# Altium schematic sheet USB.SchDoc
size A; SheetNumber: 7; SheetTotal: 9
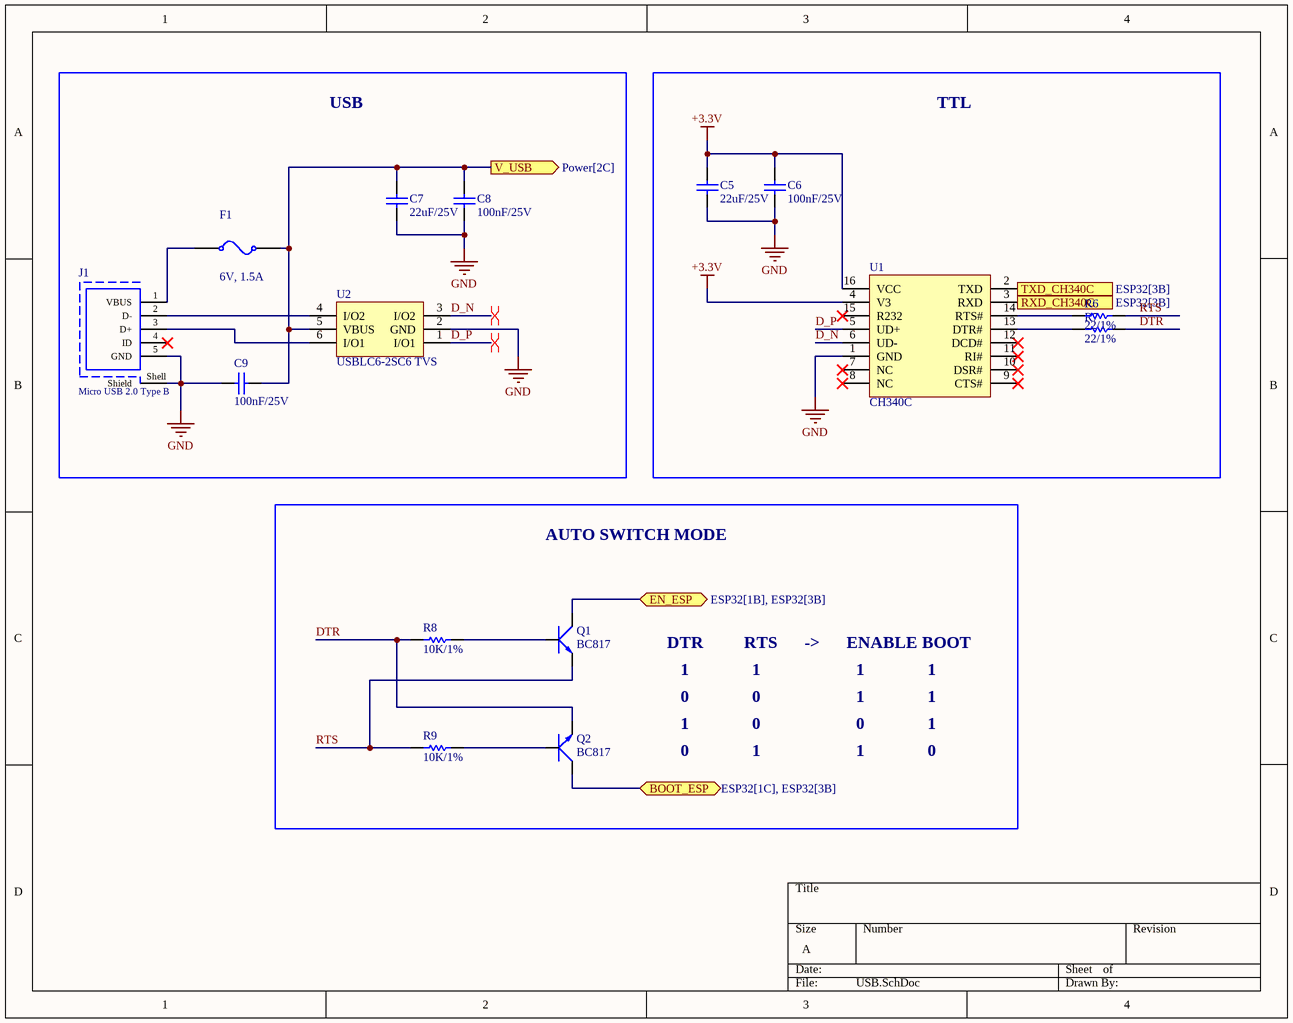
[diagram p0: USB.SchDoc]

## Parts
C5  value 22uF/25V  [CAP-SM-0805]  (hidden comment: Cap Non-Pol SMD)
C6  value 100nF/25V  [CAP-SM-0805]  (hidden comment: Cap Non-Pol SMD)
C7  value 22uF/25V  [CAP-SM-0805]  (hidden comment: Cap Non-Pol SMD)
C8  value 100nF/25V  [CAP-SM-0805]  (hidden comment: Cap Non-Pol SMD)
C9  value 100nF/25V  [CAP-SM-0805]  (hidden comment: Cap Non-Pol SMD)
F1  6V, 1.5A  [Fuse_SMD_1812]
J1  Micro USB 2.0 Type B  [629105150521]
Q1  BC817  [SOT-23]
Q2  BC817  [SOT-23]
R6  value 22/1%  [RES-SM-0805]  (hidden comment: RESISTOR SMD)
R7  value 22/1%  [RES-SM-0805]  (hidden comment: RESISTOR SMD)
R8  value 10K/1%  [RES-SM-0805]  (hidden comment: RESISTOR SMD)
R9  value 10K/1%  [RES-SM-0805]  (hidden comment: RESISTOR SMD)
U1  CH340C  [SOIC16_50_284_25X90_SMT]
U2  USBLC6-2SC6 TVS  [SOT23-6]

## Blocks framed on the sheet
USB: C7-C9 F1 J1 U2

## Ports
BOOT_ESP (bidir, see ESP32[1C], ESP32[3B]), EN_ESP (bidir, see ESP32[1B], ESP32[3B]), RXD_CH340C (in, see ESP32[3B]), TXD_CH340C (out, see ESP32[3B]), V_USB (out, see Power[2C])

## Nets
+3.3V: C5.1 C6.1 U1.4(V3) U1.16(VCC)
GND: C5.2 C6.2 C7.2 C8.2 C9.1 J1.5(GND) J1.Shell(Shield) U1.1(GND) U2.2(GND)
BOOT_ESP: Q2.3(C) ; port BOOT_ESP
D_N: U1.6(UD-) U2.3(I/O2)
D_P: U1.5(UD+) U2.1(I/O1)
DTR: Q2.2(E) R7.2 R8.1
EN_ESP: Q1.3(C) ; port EN_ESP
RTS: Q1.2(E) R6.2 R9.1
RXD_CH340C: U1.3(RXD) ; port RXD_CH340C
TXD_CH340C: U1.2(TXD) ; port TXD_CH340C
V_USB: C7.1 C8.1 C9.2 F1.1 U2.5(VBUS) ; port V_USB
NetF1_0: F1.0 J1.1(VBUS)
NetJ1_2: J1.2(D-) U2.4(I/O2)
NetJ1_3: J1.3(D+) U2.6(I/O1)
NetQ1_1: Q1.1(B) R8.2
NetQ2_1: Q2.1(B) R9.2
NetR6_1: R6.1 U1.14(RTS#)
NetR7_1: R7.1 U1.13(DTR#)

Not connected (* = marked no-connect by the designer): J1 4(ID)*; U1 7(NC)* 8(NC)* 9(CTS#)* 10(DSR#)* 11(RI#)* 12(DCD#)* 15(R232)*

## Layout directives
differential pair: D_N, D_P

## Notes on the sheet
- TTL
- AUTO SWITCH MODE
- DTR         RTS      ->      ENABLE BOOT
- 1              1
- 0              0
- 1              0
- 0              1

## Library data of the parts
C5-C9 = Cap Non-Pol SMD: Capacitor
F1 = 061812150024: Resettable Fuse, Size 1812, 24V, 1.5A; Manufacturer: Littelfuse; Threshold Current: 20A; Trip Current: 3A; Threshold Voltage: 24V; Hold Current: 1.5A; Size: 1812; Mounting Technology: SMT/SMD; ComponentLink1Description: Datasheet link; ComponentLink1URL: https://www.littelfuse.com/~/media/electronics/product_specifications/resettable_ptcs/littelfuse_ptc_minismdc300f_2_product_specification.pdf.pdf; ComponentLink2Description: Supplier 1 URL; ComponentLink2URL: https://www.mouser.vn/ProductDetail/Littelfuse/MINISMDC150F-24-2?qs=F6FIpiMdEVZ%2Fp37J%2FDHAxA%3D%3D; ComponentLink3Description: Supplier 2 URL; ComponentLink3URL: https://www.digikey.com/en/products/detail/littelfuse-inc/MINISMDC150F-24-2/1113513?s=N4IgTCBcDaILIEkByCDKcAiBhAjAVgAYAxAejABYBaCAXQF8g; ComponentLink4Description: Supplier 3 URL; ComponentLink4URL: https://www.thegioiic.com/cau-chi-tu-phuc-hoi-1812-24v-1-5a; Supplier 1 Name: Mouser; Supplier 1 SN: 650-MINISMDC150F/24; Supplier 1 URL: https://www.mouser.vn/ProductDetail/Littelfuse/MINISMDC150F-24-2?qs=F6FIpiMdEVZ%2Fp37J%2FDHAxA%3D%3D; Supplier 2 Name: Digi-Key; Supplier 2 SN: MINISMDC150F24-2TR-ND; Supplier 2 URL: https://www.mouser.vn/ProductDetail/Littelfuse/MINISMDC150F-24-2?qs=F6FIpiMdEVZ%2Fp37J%2FDHAxA%3D%3D; Supplier 3 Name: thegioiic; Supplier 3 SN: N/A; Supplier 3 URL: https://www.thegioiic.com/cau-chi-tu-phuc-hoi-1812-24v-1-5a; Value: 24V, 1.5A
J1 = 629105150521: Micro USB 2.0 Type B Receptacle WR-COM, Horizontal, SMT, with Pegs, High Current at Pin 1 & Pin 5; Rated Current: 3 A; Contact Resistance: 30 mOhm; Working Voltage: 30 VAC; ComponentLink1Description: Datasheet; ComponentLink1URL: https://katalog.we-online.de/em/datasheet/629105150521.pdf; ComponentLink2Description: Supplier 1 URL; ComponentLink2URL: N/A; Part Number: 629105150521; Published Date: September 2018; Publisher: Wurth Elektronik; Orientation: Horizontal; Connector Type: Micro USB 2.0 Type B; Operating Temperature: -40 to 85 degC; Mounting Technology: SMT; Gender: Receptacle; Packaging: Tape and Reel; ComponentLink3Description: Supplier 2 URL; ComponentLink3URL: N/A; ComponentLink4Description: Supplier 3 URL; ComponentLink4URL: N/A; Supplier 1 Name: Mouser; Supplier 1 SN: 710-629105150521; Supplier 1 URL: https://www.mouser.vn/ProductDetail/Wurth-Elektronik/629105150521?qs=a9WhcLg8qCzXiH7kZP8GRQ%3D%3D; Supplier 2 Name: Digi-Key; Supplier 2 SN: N/A; Supplier 2 URL: N/A; Supplier 3 Name: thegioiic; Supplier 3 SN: N/A; Supplier 3 URL: N/A; Value: Micro USB 2.0 Type B
Q1 Q2 = Trans BC817: SOT-23 - C8658; Value: C9014
R6-R9 = RESISTOR SMD: Resistor
U1 = CH340C: USB Bridge, USB to UART USB 2.0 UART Interface; Manufacturer: Olimex; Alternate Part Number-1: NA; Manufacturer Part Number: CH340C; Case/Package: SOIC16; Supplier-1: LCSC; Supplier Part Number-1: C84681
U2 = IC_LTC6992IS6-1: Oscillator, Silicon IC 3.81Hz ~ 1MHz TSOT-23-6; Manufacturer: Linear Technology/Analog Devices; Alternate Part Number-1: NA; Manufacturer Part Number: LTC6992IS6-1; Case/Package: SOT-23-6; Supplier-1: Arrow; Supplier Part Number-1: LTC6992IS6-1#TRMPBF